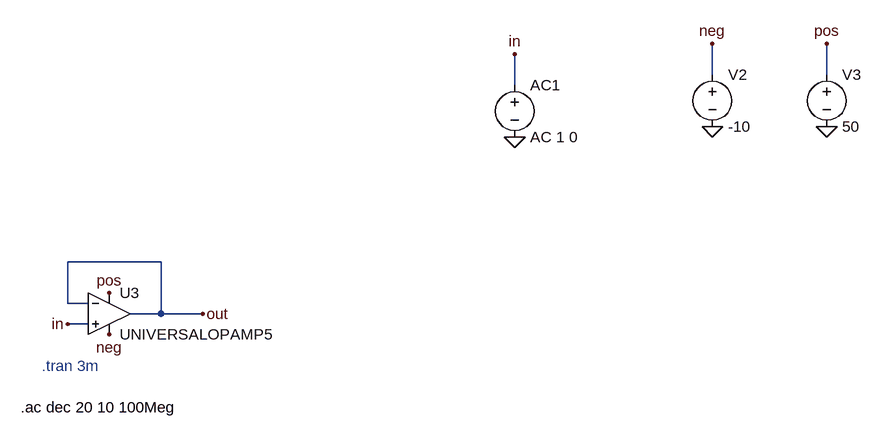
[diagram p0: schematic Draft1.asc]
Draft1.asc, the LTspice schematic file:
Version 4.1
SHEET 1 1368 680
WIRE 1136 -272 1136 -320
WIRE 1312 -272 1312 -320
WIRE 832 -256 832 -304
WIRE 288 16 144 16
WIRE 144 80 144 16
WIRE 176 80 144 80
WIRE 288 96 288 16
WIRE 288 96 240 96
WIRE 352 96 288 96
WIRE 176 112 144 112
FLAG 832 -176 0
FLAG 832 -304 in
FLAG 1136 -192 0
FLAG 1312 -192 0
FLAG 1136 -320 neg
FLAG 1312 -320 pos
FLAG 208 128 neg
FLAG 208 64 pos
FLAG 144 112 in
FLAG 352 96 out
SYMBOL voltage 832 -272 R0
WINDOW 123 0 0 Left 0
WINDOW 39 0 0 Left 0
SYMATTR InstName AC1
SYMATTR Value AC 1 0
SYMBOL voltage 1136 -288 R0
SYMATTR InstName V2
SYMATTR Value -10
SYMBOL voltage 1312 -288 R0
SYMATTR InstName V3
SYMATTR Value 50
SYMBOL OpAmps\\UniversalOpAmp5 208 96 R0
SYMATTR InstName U3
TEXT 104 176 Left 2 ;.tran 3m
TEXT 72 240 Left 2 !.ac dec 20 10 100Meg

The netlist it stands for:
* Draft1.asc
V§AC1 in 0 AC 1 0
V2 neg 0 -10
V3 pos 0 50
X§U3 in out pos neg out level5 Avol=1Meg GBW=10Meg Phimargin=45 SlewPos=10Meg SlewNeg=10Meg En=0 Enk=0 In=0 Ink=0 Rcm=500Meg Ccm=1p Rdiff=500k Cdiff=2p Ro=1k Vos=0 Ibp=2n Ibn=1n Iq=1m Rail=0 Ilimit=25m  ; UNIVERSALOPAMP5, pins In+ In- V+ V- OUT
* .tran 3m
.ac dec 20 10 100Meg
.backanno
.end

* Results of the author's LTspice run, read from the files saved beside the schematic
* Operating Point, zero values left out:
*   V(neg) = -10 V
*   V(out) = 20 µV
*   V(pos) = 50 V
*   I(AC1) = 38.04 nA
*   I(V2) = 1 mA
*   I(V3) = -1 mA
*   Ix(u3:1) = -38.04 nA
*   Ix(u3:2) = -38.96 nA
*   Ix(u3:3) = 1 mA
*   Ix(u3:4) = -1 mA
*   Ix(u3:5) = 38.96 nA
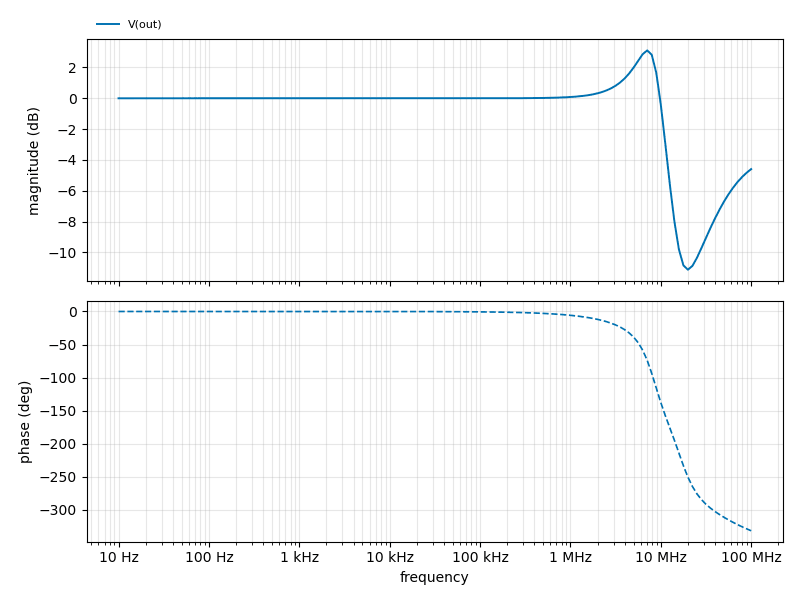
[diagram p1: AC Analysis of Draft1.asc, plotted from the saved traces]
* AC Analysis, 1 run:
*   V(out): -0.00 dB at 10 Hz, -4.59 dB at 100 MHz, peak 3.11 dB at 7.079 MHz, 3 dB below the peak at 1.092 MHz and 9.724 MHz